# Altium schematic sheet Sensor_Section.SchDoc
size A4; SheetNumber: 2; SheetTotal: 4
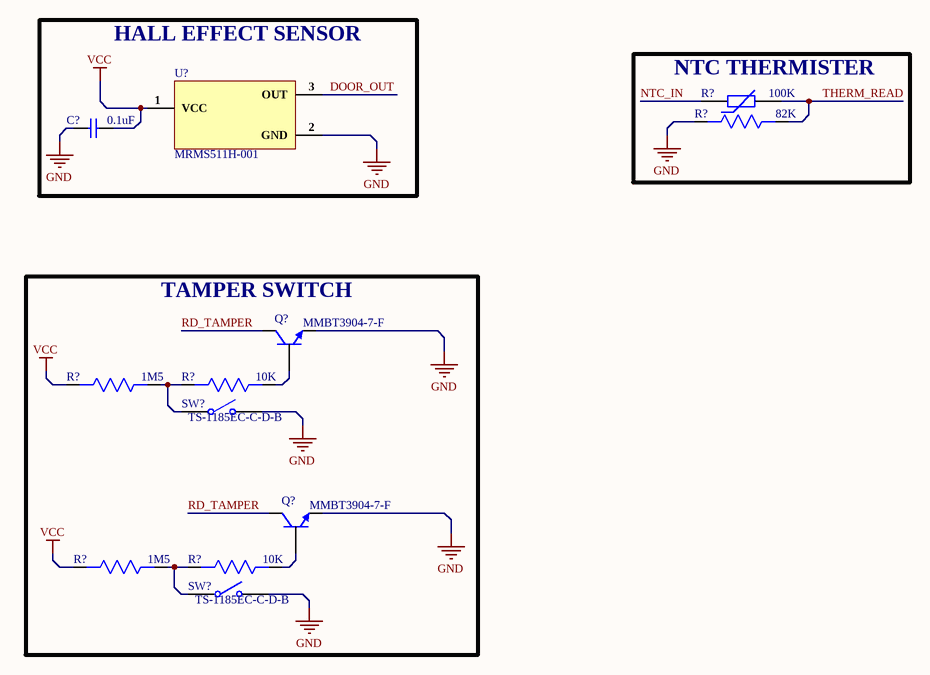
[diagram p0: Sensor_Section.SchDoc]

## Parts
(Parts that share a designator on the sheet are numbered #1, #2 ... from top to bottom, then left to right.)
C?  0.1uF  [Cap 0402]
Q?#1  MMBT3904-7-F  [SOT-23]
Q?#2  MMBT3904-7-F  [SOT-23]
R?#1  100K  [NTCLE203E3104HB0]
R?#2  82K  [Res0402]
R?#3  1M5  [Res0603]
R?#4  10K  [Res0603]
R?#5  1M5  [Res0603]
R?#6  10K  [Res0603]
SW?#1  TS-1185EC-C-D-B  [TS-1185EC-C-D-B]
SW?#2  TS-1185EC-C-D-B  [TS-1185EC-C-D-B]
U?  MRMS511H-001  [MRMS511H-001]

## Blocks framed on the sheet
HALL EFFECT SENSOR: C? U?
NTC THERMISTER: R?#1 R?#2
TAMPER SWITCH: Q?#1 Q?#2 R?#3-R?#6 SW?#1 SW?#2

## Nets
GND: C?.1 Q?#1.2(E) Q?#2.2(E) R?#2.2 SW?#1.2 SW?#2.2 U?.2(GND)
VCC: C?.2 R?#3.2 R?#5.2 U?.1(VCC)
DOOR_OUT: U?.3(OUT)
NTC_IN: R?#1.1
RD_TAMPER: Q?#1.3(C) Q?#2.3(C)
THERM_READ: R?#1.2 R?#2.1
NetQ?#1_1: Q?#1.1(B) R?#4.1
NetQ?#2_1: Q?#2.1(B) R?#6.1
NetR?#3_1: R?#3.1 R?#4.2 SW?#1.1
NetR?#5_1: R?#5.1 R?#6.2 SW?#2.1

## Notes on the sheet
- 1
- Huzaifa Ali

## Library data of the parts
C? = GRM155R71H104ME14D: CAP CER 0.1UF 50V X7R 0402; Manufacturer: Murata; Tolerance: 20%; Capacitance: 100nF; Supplier 1: Digi-Key; Manufacturer Part Number: GRM155R71H104ME14D; Stock 1: 439844; Pricing 1: 1=0.1, 10=0.038, 100=0.0168, 500=0.01198, 1000=0.00941, 2500=0.00855, 5000=0.00787 (USD); Mount: Surface Mount; Case/Package: 0402; Min Operating Temperature: -55°C; Max Operating Temperature: 125°C; Packaging: Cut Tape; Voltage Rating: 50V; Length: 0.039inch; Width: 0.02inch; Thickness: 0.022inch; ComponentLink1URL: http://search.murata.co.jp/Ceramy/image/img/A01X/G101/ENG/GRM155R71H104ME14-01.pdf?src-supplier=Digi-Key; ComponentLink1Description: http://search.murata.co.jp/Ceramy/image/img/A01X/G101/ENG/GRM155R71H104ME14-01.pdf?src-supplier=Digi-Key; ComponentLink2URL: http://psearch.en.murata.com/capacitor/product/GRM155R71H104ME14%23.pdf?src-supplier=Avnet; ComponentLink2Description: http://psearch.en.murata.com/capacitor/product/GRM155R71H104ME14%23.pdf?src-supplier=Avnet; ComponentLink3URL: http://components.arrow.com/part/dataview/0323_07177683?src-supplier=Arrow+Europe; ComponentLink3Description: http://components.arrow.com/part/dataview/0323_07177683?src-supplier=Arrow+Europe; ComponentLink4URL: http://www.mouser.com/ds/2/281/c02e-2905.pdf?src-supplier=Mouser; ComponentLink4Description: http://www.mouser.com/ds/2/281/c02e-2905.pdf?src-supplier=Mouser; Supplier Part Number 1: 490-10701-1-ND
Q?#1 Q?#2 = MMBT3904-7-F: NPN Ic=200mA Vceo=40V hfe=100~300 fT=310MHz P=300mW SOT-23; Manufacturer: Diodes Zetex; Max Power Dissipation: 300mW; Collector Emitter Voltage (VCEO): 40V; Max Collector Current: 200mA; Collector Base Voltage (VCBO): 60V; Frequency: 300MHz; hFE Min: 100; Number of Elements: 1; Emitter Base Voltage (VEBO): 6V; Collector Emitter Saturation Voltage: 300mV; Power Dissipation: 350mW; Element Configuration: Single; Supplier 1: Mouser; Manufacturer Part Number: MMBT3904-7-F; RoHS: Yes; Category: BJTs; Stock 1: 22824; Pricing 1: 1=0.12000, 10=0.11800, 50=0.11800, 100=0.06400, 500=0.04000, 1000=0.02700, 3000=0.02000, 9000=0.01700, 10000=0.01700, 24000=0.01600, 45000=0.01300 (USD); Mount: Surface Mount; Case/Package: SOT-23; Number of Pins: 3; Weight: 0.000282oz; Contact Plating: Tin,Matte; Min Operating Temperature: -55°C; Max Operating Temperature: 150°C; Polarity: NPN; Packaging: Tape and Reel; Package Quantity: 3000; Transition Frequency: 300MHz; Collector Emitter Breakdown Voltage: 40V; Max Breakdown Voltage: 40V; Continuous Collector Current: 200mA; Max Frequency: 300MHz; Gain Bandwidth Product: 300MHz; Series: -; Collector-emitter Voltage-Max: 300mV; Voltage Rating (DC): 40V; Length: 3.05mm; Width: 1.4mm; Height: 1mm; Radiation Hardening: No; REACH SVHC: No SVHC; Lead Free: Lead Free; RoHS Compliant: Yes; ComponentLink1URL: https://datasheet.ciiva.com/11201/ds30036-11201778.pdf?src-supplier=Avnet; ComponentLink1Description: https://datasheet.ciiva.com/11201/ds30036-11201778.pdf?src-supplier=Avnet; ComponentLink2URL: https://datasheet.ciiva.com/15138/getdatasheetpartid-53265-15138780.pdf?src-supplier=Verical; ComponentLink2Description: https://datasheet.ciiva.com/15138/getdatasheetpartid-53265-15138780.pdf?src-supplier=Verical; ComponentLink3URL: https://datasheet.ciiva.com/22711/1915516-22711750.pdf?src-supplier=Element14; ComponentLink3Description: https://datasheet.ciiva.com/22711/1915516-22711750.pdf?src-supplier=Element14; ComponentLink4URL: https://datasheet.ciiva.com/11198/ds30036-11198999.pdf?src-supplier=Avnet; ComponentLink4Description: https://datasheet.ciiva.com/11198/ds30036-11198999.pdf?src-supplier=Avnet; ComponentLink5URL: https://datasheet.ciiva.com/6361/ds30036-6361256.pdf?src-supplier=Digi-Key; ComponentLink5Description: https://datasheet.ciiva.com/6361/ds30036-6361256.pdf?src-supplier=Digi-Key; ComponentLink6URL: https://datasheet.ciiva.com/6361/ds30036-6361254.pdf?src-supplier=Digi-Key; ComponentLink6Description: https://datasheet.ciiva.com/6361/ds30036-6361254.pdf?src-supplier=Digi-Key; Supplier Part Number 1: 621-MMBT3904-F
R?#1 = NTCLE203E3104HB0: THERM NTC 100KOHM 4190K BEAD; Manufacturer: Vishay BCcomponents; Accuracy: 1.5%; Voltage: 500V; Max Power Dissipation: 100mW; Resistance: 100kR; Tolerance: 3%; Lead Diameter: 0.5mm; Supplier 1: Digi-Key; Manufacturer Part Number: NTCLE203E3104HB0; RoHS: Yes; Category: Thermistors; Stock 1: 9996; Pricing 1: 1=1.05000, 5=0.99800, 10=0.86900, 25=0.76360, 50=0.63440, 100=0.54040, 500=0.46992, 1000=0.41118, 5000=0.36419 (USD); Mount: Through Hole; Case/Package: Radial; Number of Pins: 2; Min Operating Temperature: -55°C; Max Operating Temperature: 125°C; Packaging: Bulk; Package Quantity: 500; Termination: Radial; Power Rating: 100mW; Length: 3.6mm; Lead Pitch: 2.54mm; Depth: 3mm; Radiation Hardening: No; ComponentLink1URL: https://datasheet.ciiva.com/8696/ntcle203-8696056.pdf?src-supplier=Avnet; ComponentLink1Description: https://datasheet.ciiva.com/8696/ntcle203-8696056.pdf?src-supplier=Avnet; ComponentLink2URL: https://datasheet.ciiva.com/2849/ntcle203-2849388.pdf?src-supplier=Digi-Key; ComponentLink2Description: https://datasheet.ciiva.com/2849/ntcle203-2849388.pdf?src-supplier=Digi-Key; Supplier Part Number 1: BC2447-ND
R?#2 = CRCW040282K0JNED: RES SMD 82K OHM 5% 1/16W 0402; Manufacturer: Vishay Dale; Resistance: 82kR; Power Rating: 63mW; Temperature Coefficient: 200ppm/°C; Voltage Rating: 50V; Supplier 1: Digi-Key; Manufacturer Part Number: CRCW040282K0JNED; RoHS: Yes; Category: Chip SMD Resistors; Stock 1: 5906; Pricing 1: 1=0.10000, 10=0.03300, 100=0.01360, 1000=0.00610, 2500=0.00529, 5000=0.00437 (USD); Case/Package: 0402; Number of Pins: 2; Weight: 2.3E-05oz; Case Code (Metric): 1005; Case Code (Imperial): 0402; Contact Plating: Tin; Min Operating Temperature: -55°C; Max Operating Temperature: 155°C; Packaging: Tape and Reel; Tolerance: 5%; Resistor Type: Thick Film; Package Quantity: 1; Number of Terminations: 2; Max Power Dissipation: 63mW; Features: Automotive AEC-Q200; Series: CRCW; Termination: SMD/SMT; Voltage Rating (DC): 50V; Construction: Rectangular; Length: 1mm; Width: 0.02inch; Height: 0.016inch; Depth: 0.5mm; Radiation Hardening: No; Lead Free: Lead Free; Military Standard: Not; RoHS Compliant: Yes; ComponentLink1URL: https://datasheet.ciiva.com/2493/dcrcwe3-2493536.pdf?src-supplier=Digi-Key; ComponentLink1Description: https://datasheet.ciiva.com/2493/dcrcwe3-2493536.pdf?src-supplier=Digi-Key; ComponentLink2URL: https://datasheet.ciiva.com/2493/dcrcwe3-2493537.pdf?src-supplier=Digi-Key; ComponentLink2Description: https://datasheet.ciiva.com/2493/dcrcwe3-2493537.pdf?src-supplier=Digi-Key; ComponentLink3URL: https://datasheet.ciiva.com/8340/dcrcwe3-8340104.pdf?src-supplier=Avnet; ComponentLink3Description: https://datasheet.ciiva.com/8340/dcrcwe3-8340104.pdf?src-supplier=Avnet; ComponentLink4URL: https://datasheet.ciiva.com/2493/dcrcwe3-2493535.pdf?src-supplier=Digi-Key; ComponentLink4Description: https://datasheet.ciiva.com/2493/dcrcwe3-2493535.pdf?src-supplier=Digi-Key; Supplier Part Number 1: 541-82KJCT-ND
R?#3 R?#5 = RC0603FR-071M5L: RES SMD 1.5M Ohm 1% 0.1W(1/10W)  0603; Manufacturer: Yageo; Power Rating: 100mW; Resistance: 1.5MR; Voltage Rating: 75V; Voltage Rating (DC): 50V; Temperature Coefficient: 100ppm/°C; Supplier 1: Digi-Key; Manufacturer Part Number: RC0603FR-071M5L; RoHS: Yes; Category: Chip SMD Resistors; Stock 1: 211390; Pricing 1: 1=0.10000, 10=0.02400, 100=0.00970, 1000=0.00436, 2500=0.00378 (USD); Case/Package: 0603; Number of Pins: 2; Case Code (Imperial): 0603; Case Code (Metric): 1608; Weight: 7.1E-05oz; Size Code: 0603; Min Operating Temperature: -55°C; Max Operating Temperature: 155°C; Resistor Type: Thick Film; Tolerance: 1%; Packaging: Tape and Reel; Termination: SMD/SMT; Features: Moisture Resistant; Series: RC; Max Power Dissipation: 100mW; Number of Terminations: 2; Construction: Rectangular; Resistance Tolerance: 1%; Technology: THICK FILM; Length: 1.6mm; Width: 0.8mm; Height: 0.45mm; Depth: 0.8mm; RoHS Compliant: Yes; REACH SVHC: No SVHC; Military Standard: Not; Lead Free: Lead Free; ComponentLink1URL: https://datasheet.ciiva.com/11819/0900766b80f96399-11819294.pdf?src-supplier=RSComponents; ComponentLink1Description: https://datasheet.ciiva.com/11819/0900766b80f96399-11819294.pdf?src-supplier=RSComponents; ComponentLink2URL: https://datasheet.ciiva.com/7746/443971-7746285.pdf?src-supplier=Element14; ComponentLink2Description: https://datasheet.ciiva.com/7746/443971-7746285.pdf?src-supplier=Element14; ComponentLink3URL: https://datasheet.ciiva.com/7746/443971-7746284.pdf?src-supplier=Element14; ComponentLink3Description: https://datasheet.ciiva.com/7746/443971-7746284.pdf?src-supplier=Element14; Supplier Part Number 1: 311-1.50MHRCT-ND
R?#4 R?#6 = RC0603FR-0710KL: RES SMD 10K OHM 1% 1/10W 0603; Manufacturer: Yageo; Resistance: 10kR; Temperature Coefficient: 100ppm/°C; Voltage Rating (DC): 50V; Power Rating: 100mW; Voltage Rating: 75V; Supplier 1: Digi-Key; Manufacturer Part Number: RC0603FR-0710KL; Stock 1: 144725424; Pricing 1: 1=0.1, 10=0.024, 100=0.0097, 1000=0.00437, 2500=0.00379 (USD); Case/Package: 0603; Number of Pins: 2; Weight: 7.1E-05oz; Case Code (Imperial): 0603; Case Code (Metric): 1608; Min Operating Temperature: -55°C; Max Operating Temperature: 155°C; Tolerance: 1%; Composition: Thick Film; Packaging: Tape and Reel; Military Standard: Not; Termination: SMD/SMT; Length: 1.6mm; Height: 0.45mm; Width: 0.8mm; Depth: 0.8mm; Lead Pitch: 0.3mm; REACH SVHC: No SVHC; Lead Free: Lead Free; ComponentLink1URL: http://www.farnell.com/datasheets/38590.pdf?src-supplier=Element14; ComponentLink1Description: http://www.farnell.com/datasheets/38590.pdf?src-supplier=Element14; ComponentLink2URL: https://www.verical.com/server-webapp/html/getDatasheet?partID=409289&src-supplier=Verical; ComponentLink2Description: https://www.verical.com/server-webapp/html/getDatasheet?partID=409289&src-supplier=Verical; ComponentLink3URL: http://www.farnell.com/datasheets/1868787.pdf?src-supplier=Element14; ComponentLink3Description: http://www.farnell.com/datasheets/1868787.pdf?src-supplier=Element14; ComponentLink4URL: http://www.farnell.com/datasheets/2167052.pdf?src-supplier=Element14; ComponentLink4Description: http://www.farnell.com/datasheets/2167052.pdf?src-supplier=Element14; ComponentLink5URL: http://www.farnell.com/datasheets/443971.pdf?src-supplier=Element14; ComponentLink5Description: http://www.farnell.com/datasheets/443971.pdf?src-supplier=Element14; Supplier Part Number 1: 311-10.0KHRDKR-ND
SW?#1 SW?#2 = TS-1185EC-C-D-B: 3mm 2mm Round Button 50mA Top3.65mm SPST 12V SMD Tactile Switches; Manufacturer: XKB; Manufacturer Part No: TS-1185EC-C-D-B; Package: Custom; ComponentLink1Description: LCSC; ComponentLink1URL: https://lcsc.com/product-detail/Tactile-Switches_XKB-Connectivity-TS-1185EC-C-D-B_C318893.html
U? = MRMS511H-001: MAG SWITCH UNIPOLAR 3MINI FLP; Manufacturer: Murata; Sensing Method: Magnetoresistive; Max Supply Current: 8uA; Polarity: South Pole; Supplier 1: Digi-Key; Manufacturer Part Number: MRMS511H-001; RoHS: Yes; Min Operating Temperature: -40°C; Max Operating Temperature: 85°C; ComponentLink1URL: http://source.z2data.com/2016/10/3/6/24/16/866/755875/l0615e.pdf?src-supplier=Digi-Key; ComponentLink1Description: http://source.z2data.com/2016/10/3/6/24/16/866/755875/l0615e.pdf?src-supplier=Digi-Key; Supplier Part Number 1: MRMS511H-001-ND